# Altium schematic sheet SegCtrl.SchDoc
size A4
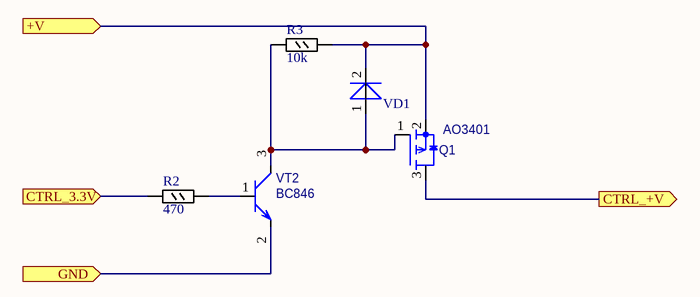
[diagram p0: SegCtrl.SchDoc]

## Parts
Q1  AO3401  [SOT23-3N]
R2  470  [RESC2012(0805)N]
R3  10k  [RESC2012(0805)N]
VD1  1A 40V  [SMA]  (value not drawn)
VT2  BC846  [SOT23-3N]

## Ports
+V (in), CTRL_3.3V (in), CTRL_+V (out), GND (in)

## Nets
+V: Q1.2(S) R3.2 VD1.2 ; port +V
CTRL_3.3V: R2.1 ; port CTRL_3.3V
CTRL_+V: Q1.3(D) ; port CTRL_+V
GND: VT2.2(E) ; port GND
NetQ1_1: Q1.1(G) R3.1 VD1.1 VT2.3(C)
NetR2_2: R2.2 VT2.1(B)

## Library data of the parts
Q1 = DMP10H4D2S-7: MOSFET P-CH 100V 270MA SOT23; Part Number: DMP10H4D2S-7; Package: DMP10H4D2S-7
R2 R3 = RESC2012(0805): Part Number: RESC2012(0805); Package: 0805
VD1 = SS14: Диод Шоттки 1A 40В [SMA / DO-214AC]; Part Number: SS14; HelpURL: http://www.vishay.com/docs/88746/ss12.pdf
VT2 = BC848: Part Number: BC848; HelpURL: http://www.nxp.com/documents/data_sheet/BC848_SER.pdf